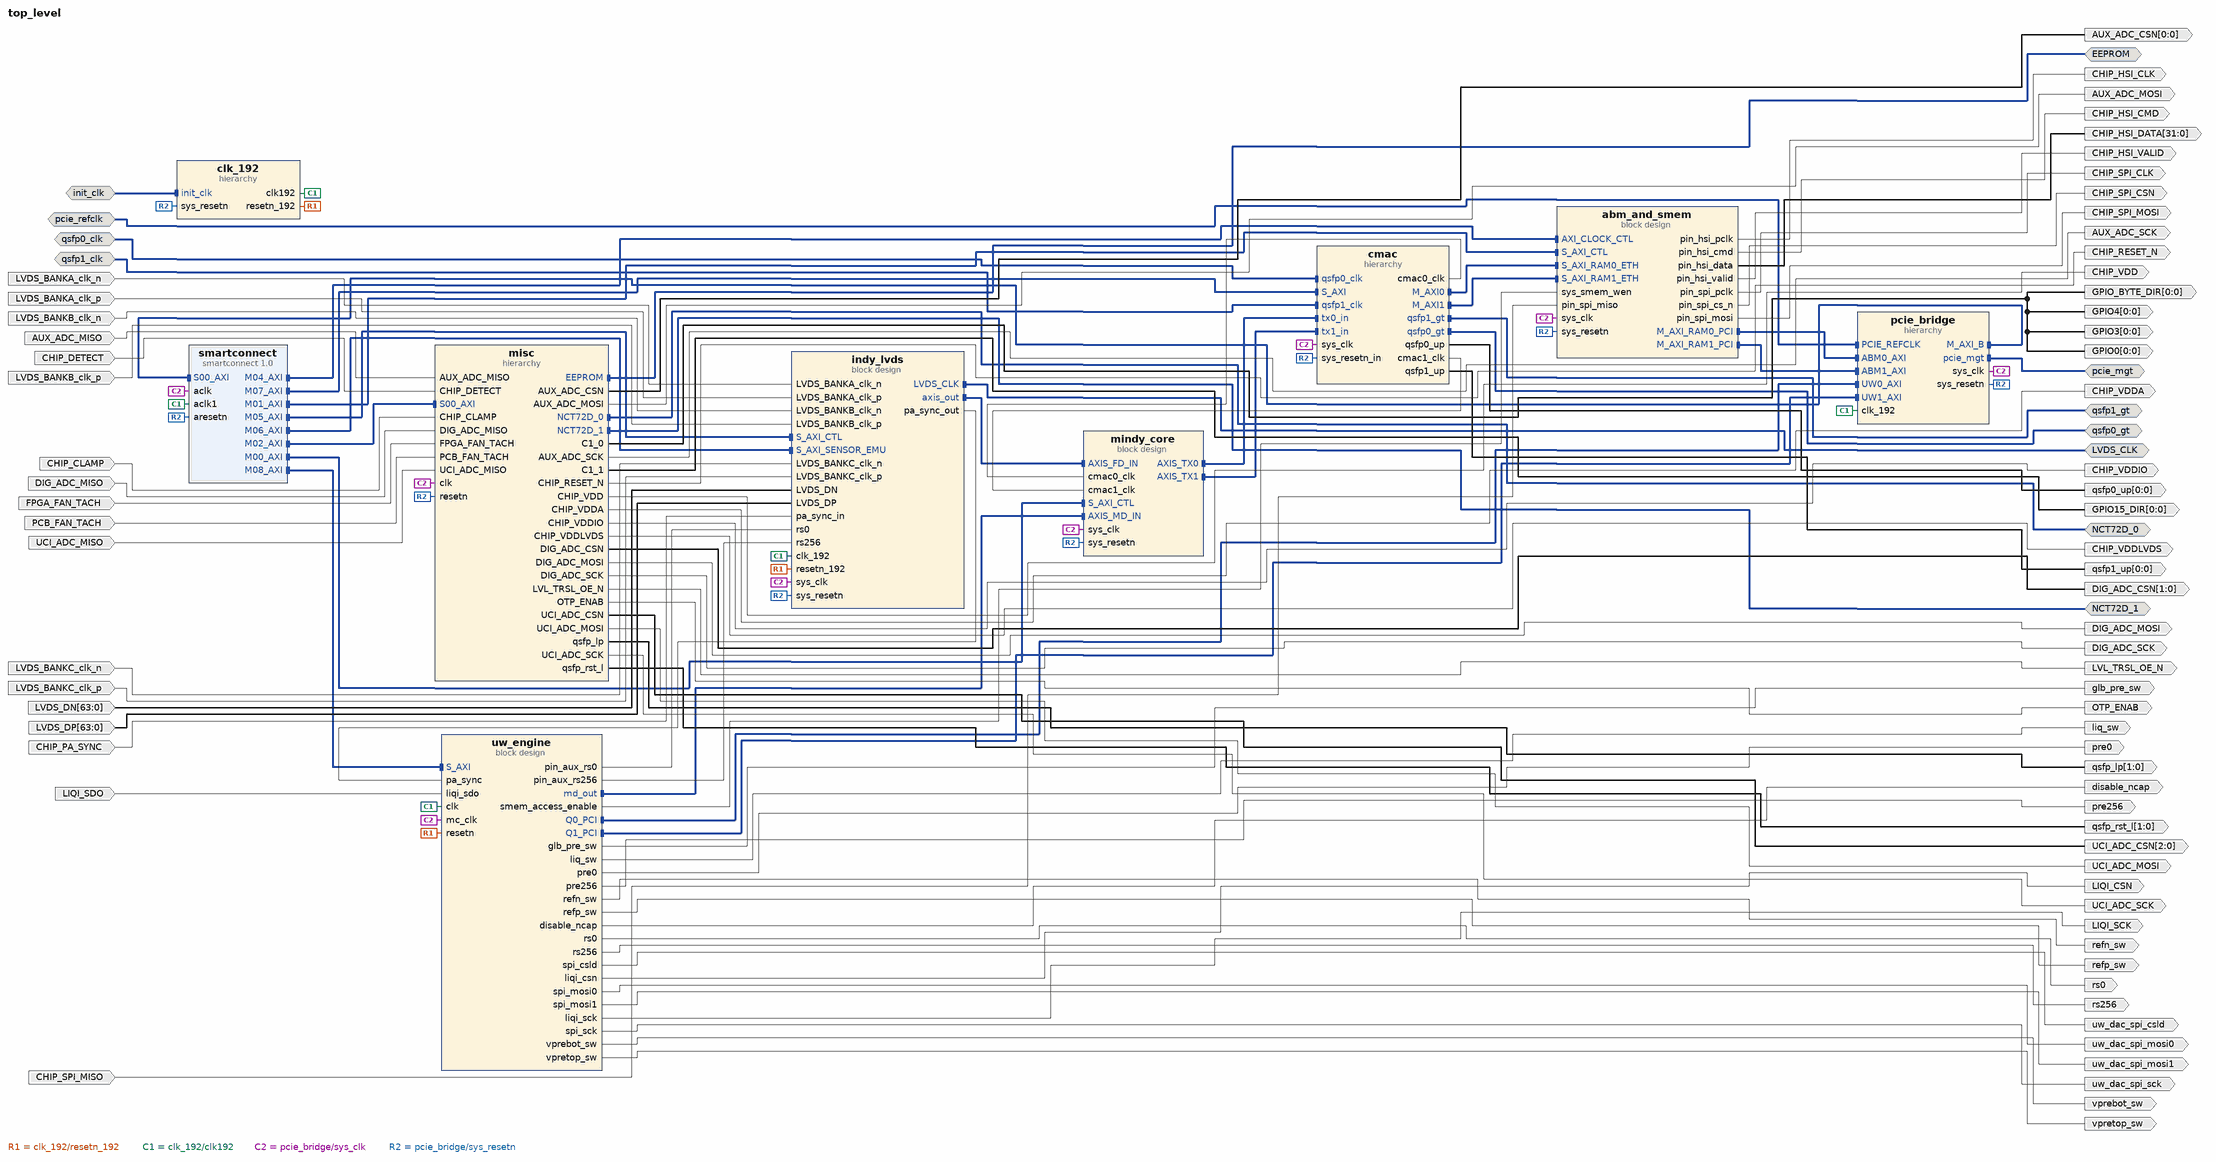
[diagram p0: block diagram of the top level]
# Vivado block design top_level, xcku15p-ffve1517-3-e, Vivado 2024.2
create_bd_design top_level

create_bd_intf_port -mode Slave -vlnv xilinx.com:interface:diff_clock_rtl:1.0 pcie_refclk
create_bd_intf_port -mode Master -vlnv xilinx.com:interface:pcie_7x_mgt_rtl:1.0 pcie_mgt
create_bd_intf_port -mode Master -vlnv xilinx.com:interface:gt_rtl:1.0 qsfp0_gt
create_bd_intf_port -mode Slave -vlnv xilinx.com:interface:diff_clock_rtl:1.0 qsfp0_clk
set_property -dict {CONFIG.FREQ_HZ 322265625} [get_bd_intf_ports qsfp0_clk]
create_bd_intf_port -mode Master -vlnv xilinx.com:interface:gt_rtl:1.0 qsfp1_gt
create_bd_intf_port -mode Slave -vlnv xilinx.com:interface:diff_clock_rtl:1.0 qsfp1_clk
set_property -dict {CONFIG.FREQ_HZ 322265625} [get_bd_intf_ports qsfp1_clk]
create_bd_intf_port -mode Slave -vlnv xilinx.com:interface:diff_clock_rtl:1.0 init_clk
set_property -dict {CONFIG.FREQ_HZ 200000000} [get_bd_intf_ports init_clk]
create_bd_intf_port -mode Master -vlnv xilinx.com:interface:diff_clock_rtl:1.0 LVDS_CLK
create_bd_intf_port -mode Master -vlnv xilinx.com:interface:iic_rtl:1.0 EEPROM
create_bd_intf_port -mode Master -vlnv xilinx.com:interface:iic_rtl:1.0 NCT72D_0
create_bd_intf_port -mode Master -vlnv xilinx.com:interface:iic_rtl:1.0 NCT72D_1
create_bd_port -dir O -from 0 -to 0 qsfp0_up
create_bd_port -dir O -from 0 -to 0 qsfp1_up
create_bd_port -dir O CHIP_HSI_CLK
create_bd_port -dir O CHIP_HSI_CMD
create_bd_port -dir O -from 31 -to 0 CHIP_HSI_DATA
create_bd_port -dir O CHIP_HSI_VALID
create_bd_port -dir O CHIP_SPI_CLK
create_bd_port -dir O CHIP_SPI_CSN
create_bd_port -dir O CHIP_SPI_MOSI
create_bd_port -dir I CHIP_SPI_MISO
create_bd_port -dir O CHIP_VDDIO
create_bd_port -dir O CHIP_VDD
create_bd_port -dir O CHIP_VDDLVDS
create_bd_port -dir O CHIP_VDDA
create_bd_port -dir O CHIP_RESET_N
create_bd_port -dir O -from 2 -to 0 UCI_ADC_CSN
create_bd_port -dir O UCI_ADC_SCK
create_bd_port -dir O UCI_ADC_MOSI
create_bd_port -dir I UCI_ADC_MISO
create_bd_port -dir O LVL_TRSL_OE_N
create_bd_port -dir O -from 1 -to 0 qsfp_rst_l
create_bd_port -dir O -from 1 -to 0 qsfp_lp
create_bd_port -dir I LVDS_BANKA_clk_n
create_bd_port -dir I LVDS_BANKA_clk_p
create_bd_port -dir I LVDS_BANKB_clk_n
create_bd_port -dir I LVDS_BANKB_clk_p
create_bd_port -dir I LVDS_BANKC_clk_n
create_bd_port -dir I LVDS_BANKC_clk_p
create_bd_port -dir I -from 63 -to 0 LVDS_DN
create_bd_port -dir I -from 63 -to 0 LVDS_DP
create_bd_port -dir I CHIP_PA_SYNC
create_bd_port -dir O rs0
create_bd_port -dir O rs256
create_bd_port -dir O -from 0 -to 0 GPIO_BYTE_DIR
create_bd_port -dir O -from 0 -to 0 GPIO15_DIR
create_bd_port -dir O glb_pre_sw
create_bd_port -dir O liq_sw
create_bd_port -dir O pre0
create_bd_port -dir O pre256
create_bd_port -dir O refn_sw
create_bd_port -dir O refp_sw
create_bd_port -dir O uw_dac_spi_csld
create_bd_port -dir O uw_dac_spi_mosi0
create_bd_port -dir O uw_dac_spi_mosi1
create_bd_port -dir O uw_dac_spi_sck
create_bd_port -dir O vprebot_sw
create_bd_port -dir O vpretop_sw
create_bd_port -dir O -from 0 -to 0 GPIO0
create_bd_port -dir O -from 0 -to 0 GPIO3
create_bd_port -dir O -from 0 -to 0 GPIO4
create_bd_port -dir O disable_ncap
create_bd_port -dir I DIG_ADC_MISO
create_bd_port -dir O DIG_ADC_SCK
create_bd_port -dir O DIG_ADC_MOSI
create_bd_port -dir O -from 1 -to 0 DIG_ADC_CSN
create_bd_port -dir I FPGA_FAN_TACH
create_bd_port -dir I PCB_FAN_TACH
create_bd_port -dir O AUX_ADC_SCK
create_bd_port -dir O AUX_ADC_MOSI
create_bd_port -dir I AUX_ADC_MISO
create_bd_port -dir O -from 0 -to 0 AUX_ADC_CSN
create_bd_port -dir O LIQI_SCK
create_bd_port -dir O LIQI_CSN
create_bd_port -dir I LIQI_SDO
create_bd_port -dir I CHIP_CLAMP
create_bd_port -dir I CHIP_DETECT
create_bd_port -dir O OTP_ENAB

create_bd_cell -type hier pcie_bridge
create_bd_cell -type ip -vlnv xilinx.com:ip:smartconnect:1.0 smartconnect
set_property -dict {CONFIG.NUM_CLKS 2 CONFIG.NUM_MI 9 CONFIG.NUM_SI 1} [get_bd_cells smartconnect]
create_bd_cell -type container -reference abm_and_smem abm_and_smem
set_property -dict [list \
  CONFIG.ACTIVE_SIM_BD abm_and_smem.bd \
  CONFIG.ACTIVE_SYNTH_BD abm_and_smem.bd \
  CONFIG.ENABLE_DFX 0 \
  CONFIG.LIST_SIM_BD abm_and_smem.bd \
  CONFIG.LIST_SYNTH_BD abm_and_smem.bd \
  CONFIG.LOCK_PROPAGATE 0 \
] [get_bd_cells abm_and_smem]
create_bd_cell -type hier cmac
create_bd_cell -type container -reference mindy_core mindy_core
set_property -dict [list \
  CONFIG.ACTIVE_SIM_BD mindy_core.bd \
  CONFIG.ACTIVE_SYNTH_BD mindy_core.bd \
  CONFIG.ENABLE_DFX 0 \
  CONFIG.LIST_SIM_BD mindy_core.bd \
  CONFIG.LIST_SYNTH_BD mindy_core.bd \
  CONFIG.LOCK_PROPAGATE 0 \
] [get_bd_cells mindy_core]
create_bd_cell -type container -reference indy_lvds indy_lvds
set_property -dict [list \
  CONFIG.ACTIVE_SIM_BD indy_lvds.bd \
  CONFIG.ACTIVE_SYNTH_BD indy_lvds.bd \
  CONFIG.ENABLE_DFX 0 \
  CONFIG.LIST_SIM_BD indy_lvds.bd \
  CONFIG.LIST_SYNTH_BD indy_lvds.bd \
  CONFIG.LOCK_PROPAGATE 0 \
] [get_bd_cells indy_lvds]
create_bd_cell -type hier clk_192
create_bd_cell -type hier misc
create_bd_cell -type container -reference userwave uw_engine
set_property -dict [list \
  CONFIG.ACTIVE_SIM_BD userwave.bd \
  CONFIG.ACTIVE_SYNTH_BD userwave.bd \
  CONFIG.ENABLE_DFX 0 \
  CONFIG.LIST_SIM_BD userwave.bd \
  CONFIG.LIST_SYNTH_BD userwave.bd \
  CONFIG.LOCK_PROPAGATE 0 \
] [get_bd_cells uw_engine]

# ---- hierarchy /pcie_bridge ----
current_bd_instance /pcie_bridge
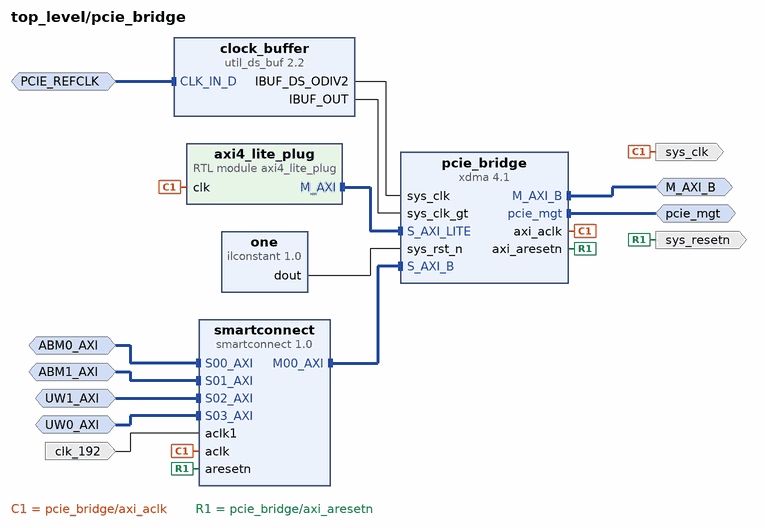
[diagram p1: block diagram inside /pcie_bridge]
create_bd_intf_pin -mode Slave -vlnv xilinx.com:interface:diff_clock_rtl:1.0 PCIE_REFCLK
create_bd_intf_pin -mode Slave -vlnv xilinx.com:interface:aximm_rtl:1.0 ABM0_AXI
create_bd_intf_pin -mode Slave -vlnv xilinx.com:interface:aximm_rtl:1.0 ABM1_AXI
create_bd_intf_pin -mode Master -vlnv xilinx.com:interface:pcie_7x_mgt_rtl:1.0 pcie_mgt
create_bd_intf_pin -mode Master -vlnv xilinx.com:interface:aximm_rtl:1.0 M_AXI_B
create_bd_intf_pin -mode Slave -vlnv xilinx.com:interface:aximm_rtl:1.0 UW1_AXI
create_bd_intf_pin -mode Slave -vlnv xilinx.com:interface:aximm_rtl:1.0 UW0_AXI
create_bd_pin -dir O -type clk sys_clk
create_bd_pin -dir O -type rst sys_resetn
create_bd_pin -dir I clk_192

create_bd_cell -type ip -vlnv xilinx.com:ip:util_ds_buf:2.2 clock_buffer
set_property -dict {CONFIG.C_BUF_TYPE IBUFDSGTE} [get_bd_cells clock_buffer]
create_bd_cell -type ip -vlnv xilinx.com:ip:smartconnect:1.0 smartconnect
set_property -dict {CONFIG.NUM_CLKS 2 CONFIG.NUM_MI 1 CONFIG.NUM_SI 4} [get_bd_cells smartconnect]
create_bd_cell -type module -reference axi4_lite_plug axi4_lite_plug
create_bd_cell -type ip -vlnv xilinx.com:ip:xdma:4.1 pcie_bridge
set_property -dict [list \
  CONFIG.PF0_DEVICE_ID_mqdma 903F \
  CONFIG.PF0_SRIOV_VF_DEVICE_ID A03F \
  CONFIG.PF2_DEVICE_ID_mqdma 923F \
  CONFIG.PF3_DEVICE_ID_mqdma 933F \
  CONFIG.axi_addr_width 64 \
  CONFIG.axi_data_width 512_bit \
  CONFIG.axisten_freq 250 \
  CONFIG.bridge_burst true \
  CONFIG.en_axi_slave_if true \
  CONFIG.en_gt_selection false \
  CONFIG.functional_mode AXI_Bridge \
  CONFIG.mode_selection Advanced \
  CONFIG.pcie_blk_locn X0Y3 \
  CONFIG.pf0_bar0_scale Megabytes \
  CONFIG.pf0_bar0_size 1 \
  CONFIG.pf0_device_id 903F \
  CONFIG.pf0_msi_enabled false \
  CONFIG.pl_link_cap_max_link_speed 8.0_GT/s \
  CONFIG.pl_link_cap_max_link_width X16 \
  CONFIG.runbit_fix false \
  CONFIG.xlnx_ref_board None \
] [get_bd_cells pcie_bridge]
create_bd_cell -type inline_hdl -vlnv xilinx.com:inline_hdl:ilconstant:1.0 one

# ---- hierarchy /cmac ----
current_bd_instance /cmac
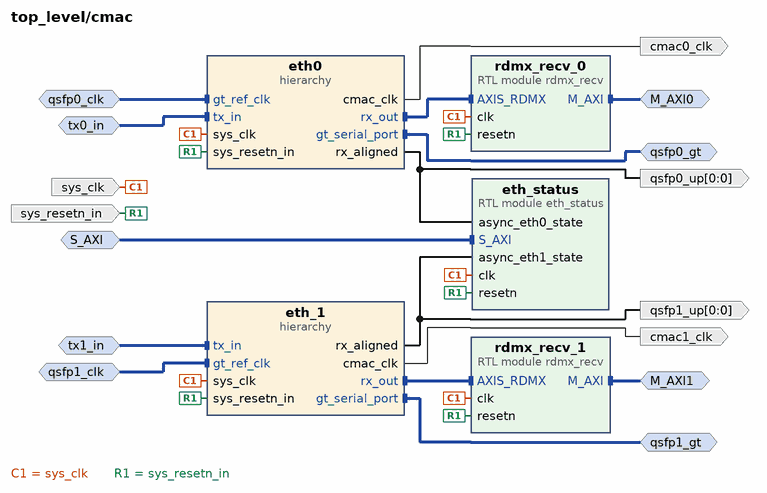
[diagram p2: block diagram inside /cmac]
create_bd_intf_pin -mode Master -vlnv xilinx.com:interface:gt_rtl:1.0 qsfp0_gt
create_bd_intf_pin -mode Slave -vlnv xilinx.com:interface:diff_clock_rtl:1.0 qsfp0_clk
create_bd_intf_pin -mode Slave -vlnv xilinx.com:interface:axis_rtl:1.0 tx0_in
create_bd_intf_pin -mode Master -vlnv xilinx.com:interface:aximm_rtl:1.0 M_AXI0
create_bd_intf_pin -mode Master -vlnv xilinx.com:interface:gt_rtl:1.0 qsfp1_gt
create_bd_intf_pin -mode Slave -vlnv xilinx.com:interface:diff_clock_rtl:1.0 qsfp1_clk
create_bd_intf_pin -mode Slave -vlnv xilinx.com:interface:axis_rtl:1.0 tx1_in
create_bd_intf_pin -mode Master -vlnv xilinx.com:interface:aximm_rtl:1.0 M_AXI1
create_bd_intf_pin -mode Slave -vlnv xilinx.com:interface:aximm_rtl:1.0 S_AXI
create_bd_pin -dir I sys_clk
create_bd_pin -dir I sys_resetn_in
create_bd_pin -dir O -from 0 -to 0 qsfp0_up
create_bd_pin -dir O cmac0_clk
create_bd_pin -dir O -from 0 -to 0 qsfp1_up
create_bd_pin -dir O cmac1_clk

create_bd_cell -type hier eth0
create_bd_cell -type module -reference rdmx_recv rdmx_recv_0
create_bd_cell -type hier eth_1
create_bd_cell -type module -reference rdmx_recv rdmx_recv_1
create_bd_cell -type module -reference eth_status eth_status

# ---- hierarchy /cmac/eth0 ----
current_bd_instance /cmac/eth0
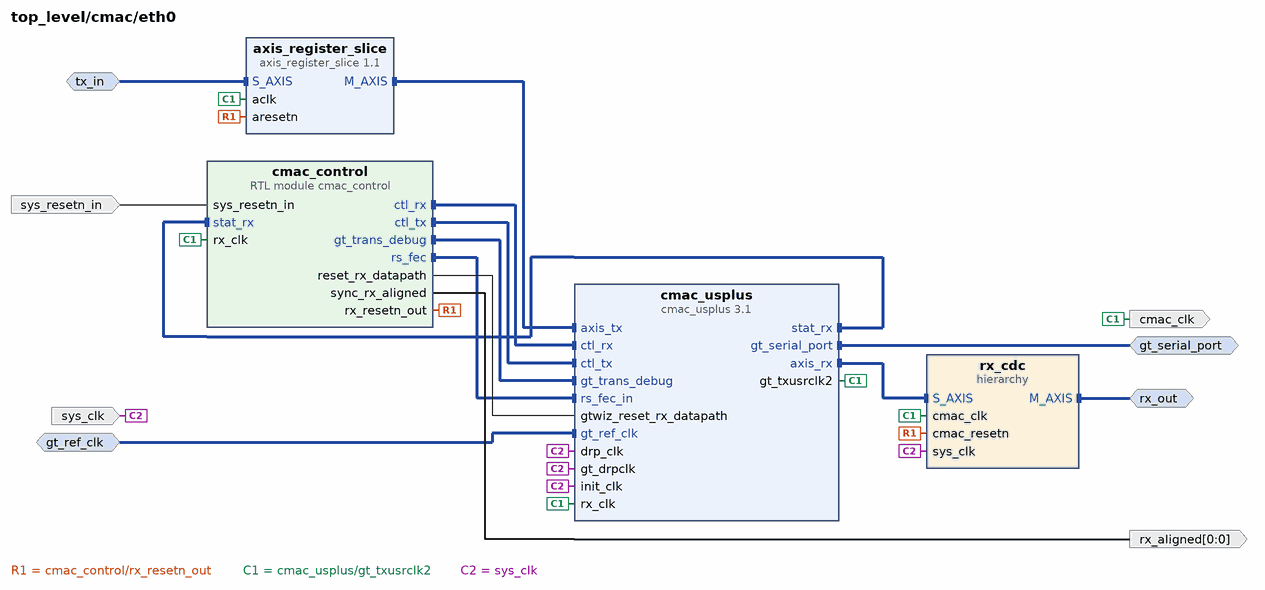
[diagram p3: block diagram inside /cmac/eth0]
create_bd_intf_pin -mode Master -vlnv xilinx.com:interface:gt_rtl:1.0 gt_serial_port
create_bd_intf_pin -mode Slave -vlnv xilinx.com:interface:diff_clock_rtl:1.0 gt_ref_clk
create_bd_intf_pin -mode Master -vlnv xilinx.com:interface:axis_rtl:1.0 rx_out
create_bd_intf_pin -mode Slave -vlnv xilinx.com:interface:axis_rtl:1.0 tx_in
create_bd_pin -dir I sys_resetn_in
create_bd_pin -dir I sys_clk
create_bd_pin -dir O -from 0 -to 0 rx_aligned
create_bd_pin -dir O cmac_clk

create_bd_cell -type ip -vlnv xilinx.com:ip:cmac_usplus:3.1 cmac_usplus
set_property -dict [list \
  CONFIG.ADD_GT_CNRL_STS_PORTS 1 \
  CONFIG.CMAC_CAUI4_MODE 1 \
  CONFIG.CMAC_CORE_SELECT CMACE4_X0Y0 \
  CONFIG.DIFFCLK_BOARD_INTERFACE Custom \
  CONFIG.ETHERNET_BOARD_INTERFACE Custom \
  CONFIG.GT_DRP_CLK 250 \
  CONFIG.GT_GROUP_SELECT {X0Y0~X0Y3} \
  CONFIG.GT_REF_CLK_FREQ 322.265625 \
  CONFIG.INCLUDE_RS_FEC 1 \
  CONFIG.NUM_LANES 4x25 \
  CONFIG.RX_FLOW_CONTROL 0 \
  CONFIG.RX_GT_BUFFER 1 \
  CONFIG.TX_FLOW_CONTROL 0 \
  CONFIG.USER_INTERFACE AXIS \
] [get_bd_cells cmac_usplus]
create_bd_cell -type module -reference cmac_control cmac_control
set_property -dict {CONFIG.TX_PRECURSOR {"10100"}} [get_bd_cells cmac_control]
create_bd_cell -type hier rx_cdc
create_bd_cell -type ip -vlnv xilinx.com:ip:axis_register_slice:1.1 axis_register_slice

# ---- hierarchy /cmac/eth0/rx_cdc ----
current_bd_instance /cmac/eth0/rx_cdc
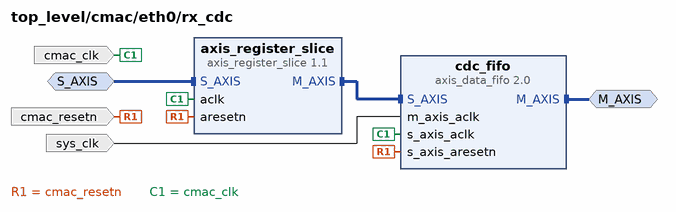
[diagram p4: block diagram inside /cmac/eth0/rx_cdc]
create_bd_intf_pin -mode Slave -vlnv xilinx.com:interface:axis_rtl:1.0 S_AXIS
create_bd_intf_pin -mode Master -vlnv xilinx.com:interface:axis_rtl:1.0 M_AXIS
create_bd_pin -dir I -type rst cmac_resetn
create_bd_pin -dir I -type clk cmac_clk
create_bd_pin -dir I sys_clk

create_bd_cell -type ip -vlnv xilinx.com:ip:axis_data_fifo:2.0 cdc_fifo
set_property -dict {CONFIG.FIFO_DEPTH 16 CONFIG.IS_ACLK_ASYNC 1} [get_bd_cells cdc_fifo]
create_bd_cell -type ip -vlnv xilinx.com:ip:axis_register_slice:1.1 axis_register_slice

# ---- hierarchy /cmac/eth_1 ----
current_bd_instance /cmac/eth_1
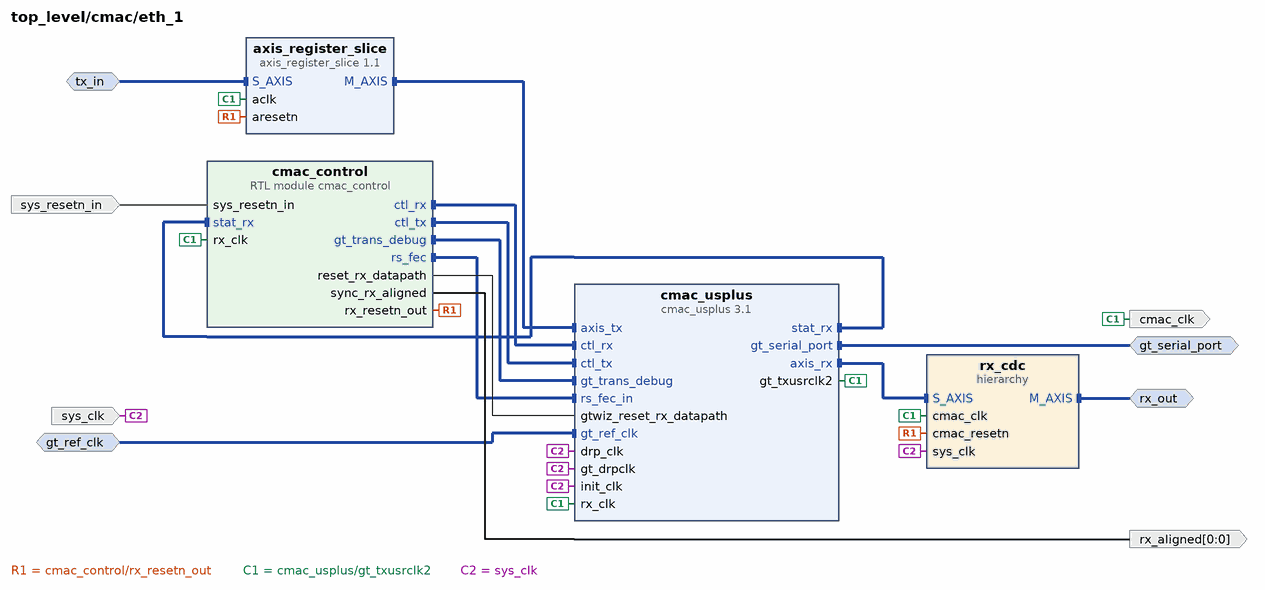
[diagram p5: block diagram inside /cmac/eth_1]
create_bd_intf_pin -mode Master -vlnv xilinx.com:interface:gt_rtl:1.0 gt_serial_port
create_bd_intf_pin -mode Slave -vlnv xilinx.com:interface:diff_clock_rtl:1.0 gt_ref_clk
create_bd_intf_pin -mode Master -vlnv xilinx.com:interface:axis_rtl:1.0 rx_out
create_bd_intf_pin -mode Slave -vlnv xilinx.com:interface:axis_rtl:1.0 tx_in
create_bd_pin -dir I sys_resetn_in
create_bd_pin -dir I sys_clk
create_bd_pin -dir O -from 0 -to 0 rx_aligned
create_bd_pin -dir O cmac_clk

create_bd_cell -type ip -vlnv xilinx.com:ip:cmac_usplus:3.1 cmac_usplus
set_property -dict [list \
  CONFIG.ADD_GT_CNRL_STS_PORTS 1 \
  CONFIG.CMAC_CAUI4_MODE 1 \
  CONFIG.CMAC_CORE_SELECT CMACE4_X0Y1 \
  CONFIG.DIFFCLK_BOARD_INTERFACE Custom \
  CONFIG.ETHERNET_BOARD_INTERFACE Custom \
  CONFIG.GT_DRP_CLK 250 \
  CONFIG.GT_GROUP_SELECT {X0Y4~X0Y7} \
  CONFIG.GT_REF_CLK_FREQ 322.265625 \
  CONFIG.INCLUDE_RS_FEC 1 \
  CONFIG.NUM_LANES 4x25 \
  CONFIG.RX_FLOW_CONTROL 0 \
  CONFIG.RX_GT_BUFFER 1 \
  CONFIG.TX_FLOW_CONTROL 0 \
  CONFIG.USER_INTERFACE AXIS \
] [get_bd_cells cmac_usplus]
create_bd_cell -type module -reference cmac_control cmac_control
set_property -dict {CONFIG.TX_PRECURSOR {"10100"}} [get_bd_cells cmac_control]
create_bd_cell -type hier rx_cdc
create_bd_cell -type ip -vlnv xilinx.com:ip:axis_register_slice:1.1 axis_register_slice

# ---- hierarchy /cmac/eth_1/rx_cdc ----
current_bd_instance /cmac/eth_1/rx_cdc
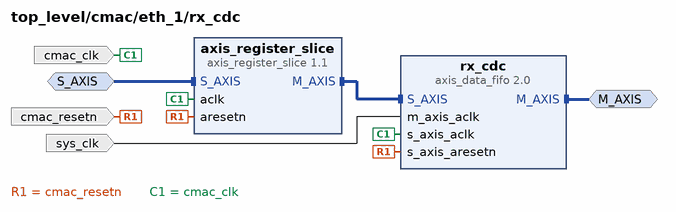
[diagram p6: block diagram inside /cmac/eth_1/rx_cdc]
create_bd_intf_pin -mode Slave -vlnv xilinx.com:interface:axis_rtl:1.0 S_AXIS
create_bd_intf_pin -mode Master -vlnv xilinx.com:interface:axis_rtl:1.0 M_AXIS
create_bd_pin -dir I -type rst cmac_resetn
create_bd_pin -dir I -type clk cmac_clk
create_bd_pin -dir I sys_clk

create_bd_cell -type ip -vlnv xilinx.com:ip:axis_data_fifo:2.0 rx_cdc
set_property -dict {CONFIG.FIFO_DEPTH 16 CONFIG.IS_ACLK_ASYNC 1} [get_bd_cells rx_cdc]
create_bd_cell -type ip -vlnv xilinx.com:ip:axis_register_slice:1.1 axis_register_slice

# ---- hierarchy /clk_192 ----
current_bd_instance /clk_192
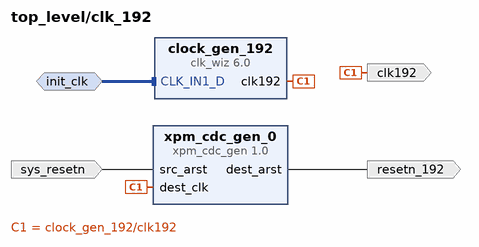
[diagram p7: block diagram inside /clk_192]
create_bd_intf_pin -mode Slave -vlnv xilinx.com:interface:diff_clock_rtl:1.0 init_clk
create_bd_pin -dir O -type clk clk192
create_bd_pin -dir I sys_resetn
create_bd_pin -dir O resetn_192

create_bd_cell -type ip -vlnv xilinx.com:ip:clk_wiz:6.0 clock_gen_192
set_property -dict [list \
  CONFIG.CLKOUT1_JITTER 93.529 \
  CONFIG.CLKOUT1_REQUESTED_OUT_FREQ 192 \
  CONFIG.CLK_OUT1_PORT clk192 \
  CONFIG.MMCM_CLKOUT0_DIVIDE_F 6.250 \
  CONFIG.PRIM_SOURCE Differential_clock_capable_pin \
  CONFIG.USE_LOCKED false \
  CONFIG.USE_RESET false \
] [get_bd_cells clock_gen_192]
create_bd_cell -type ip -vlnv xilinx.com:ip:xpm_cdc_gen:1.0 xpm_cdc_gen_0
set_property -dict {CONFIG.CDC_TYPE xpm_cdc_async_rst} [get_bd_cells xpm_cdc_gen_0]

# ---- hierarchy /misc ----
current_bd_instance /misc
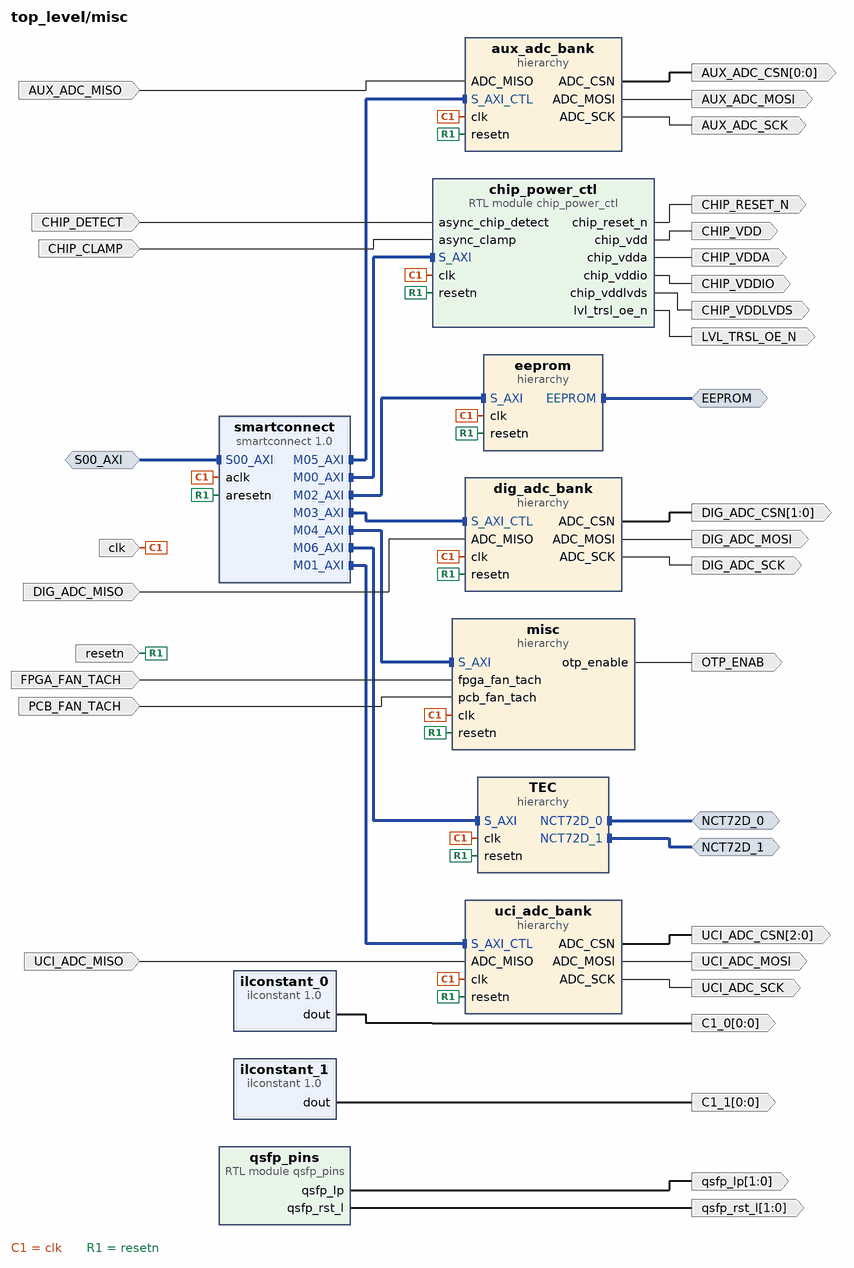
[diagram p8: block diagram inside /misc]
create_bd_intf_pin -mode Slave -vlnv xilinx.com:interface:aximm_rtl:1.0 S00_AXI
create_bd_intf_pin -mode Master -vlnv xilinx.com:interface:iic_rtl:1.0 EEPROM
create_bd_intf_pin -mode Master -vlnv xilinx.com:interface:iic_rtl:1.0 NCT72D_0
create_bd_intf_pin -mode Master -vlnv xilinx.com:interface:iic_rtl:1.0 NCT72D_1
create_bd_pin -dir O -from 0 -to 0 C1_0
create_bd_pin -dir O -from 0 -to 0 C1_1
create_bd_pin -dir O CHIP_VDDIO
create_bd_pin -dir O CHIP_VDD
create_bd_pin -dir O CHIP_VDDLVDS
create_bd_pin -dir O CHIP_VDDA
create_bd_pin -dir O CHIP_RESET_N
create_bd_pin -dir O LVL_TRSL_OE_N
create_bd_pin -dir I -type clk clk
create_bd_pin -dir I -type rst resetn
create_bd_pin -dir O -from 1 -to 0 qsfp_rst_l
create_bd_pin -dir O -from 1 -to 0 qsfp_lp
create_bd_pin -dir O -from 2 -to 0 UCI_ADC_CSN
create_bd_pin -dir O UCI_ADC_SCK
create_bd_pin -dir O UCI_ADC_MOSI
create_bd_pin -dir I UCI_ADC_MISO
create_bd_pin -dir I DIG_ADC_MISO
create_bd_pin -dir O DIG_ADC_SCK
create_bd_pin -dir O DIG_ADC_MOSI
create_bd_pin -dir O -from 1 -to 0 DIG_ADC_CSN
create_bd_pin -dir I FPGA_FAN_TACH
create_bd_pin -dir I PCB_FAN_TACH
create_bd_pin -dir O AUX_ADC_SCK
create_bd_pin -dir O AUX_ADC_MOSI
create_bd_pin -dir O -from 0 -to 0 AUX_ADC_CSN
create_bd_pin -dir I AUX_ADC_MISO
create_bd_pin -dir I CHIP_CLAMP
create_bd_pin -dir I CHIP_DETECT
create_bd_pin -dir O OTP_ENAB

create_bd_cell -type inline_hdl -vlnv xilinx.com:inline_hdl:ilconstant:1.0 ilconstant_0
set_property -dict {CONFIG.CONST_VAL 0} [get_bd_cells ilconstant_0]
create_bd_cell -type inline_hdl -vlnv xilinx.com:inline_hdl:ilconstant:1.0 ilconstant_1
set_property -dict {CONFIG.CONST_VAL 1} [get_bd_cells ilconstant_1]
create_bd_cell -type module -reference qsfp_pins qsfp_pins
create_bd_cell -type hier uci_adc_bank
create_bd_cell -type module -reference chip_power_ctl chip_power_ctl
create_bd_cell -type ip -vlnv xilinx.com:ip:smartconnect:1.0 smartconnect
set_property -dict {CONFIG.NUM_MI 7 CONFIG.NUM_SI 1} [get_bd_cells smartconnect]
create_bd_cell -type hier dig_adc_bank
create_bd_cell -type hier misc
create_bd_cell -type hier aux_adc_bank
create_bd_cell -type hier eeprom
create_bd_cell -type hier TEC

# ---- hierarchy /misc/uci_adc_bank ----
current_bd_instance /misc/uci_adc_bank
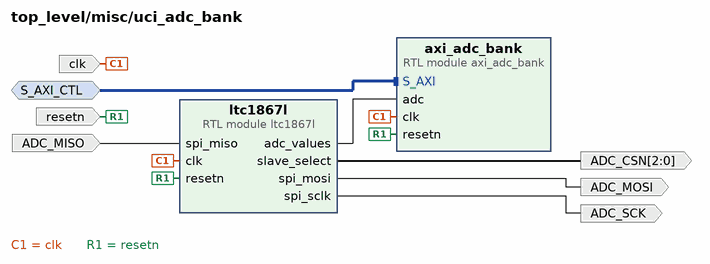
[diagram p9: block diagram inside /misc/uci_adc_bank]
create_bd_intf_pin -mode Slave -vlnv xilinx.com:interface:aximm_rtl:1.0 S_AXI_CTL
create_bd_pin -dir I -type clk clk
create_bd_pin -dir I -type rst resetn
create_bd_pin -dir O -from 2 -to 0 ADC_CSN
create_bd_pin -dir O ADC_SCK
create_bd_pin -dir O ADC_MOSI
create_bd_pin -dir I ADC_MISO

create_bd_cell -type module -reference axi_adc_bank axi_adc_bank
set_property -dict {CONFIG.ADC_COUNT 3} [get_bd_cells axi_adc_bank]
create_bd_cell -type module -reference ltc1867l ltc1867l
set_property -dict {CONFIG.ADC_COUNT 3} [get_bd_cells ltc1867l]

# ---- hierarchy /misc/dig_adc_bank ----
current_bd_instance /misc/dig_adc_bank
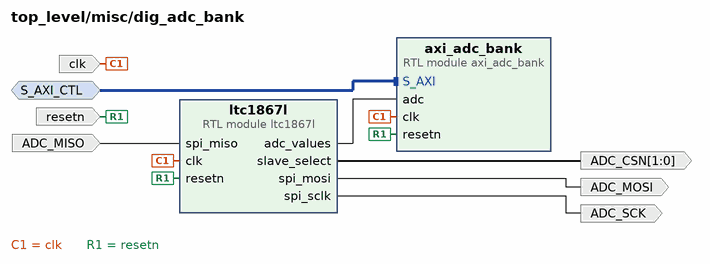
[diagram p10: block diagram inside /misc/dig_adc_bank]
create_bd_intf_pin -mode Slave -vlnv xilinx.com:interface:aximm_rtl:1.0 S_AXI_CTL
create_bd_pin -dir I -type clk clk
create_bd_pin -dir I -type rst resetn
create_bd_pin -dir O ADC_SCK
create_bd_pin -dir O ADC_MOSI
create_bd_pin -dir I ADC_MISO
create_bd_pin -dir O -from 1 -to 0 ADC_CSN

create_bd_cell -type module -reference axi_adc_bank axi_adc_bank
set_property -dict {CONFIG.ADC_COUNT 2} [get_bd_cells axi_adc_bank]
create_bd_cell -type module -reference ltc1867l ltc1867l
set_property -dict {CONFIG.ADC_COUNT 2} [get_bd_cells ltc1867l]

# ---- hierarchy /misc/misc ----
current_bd_instance /misc/misc
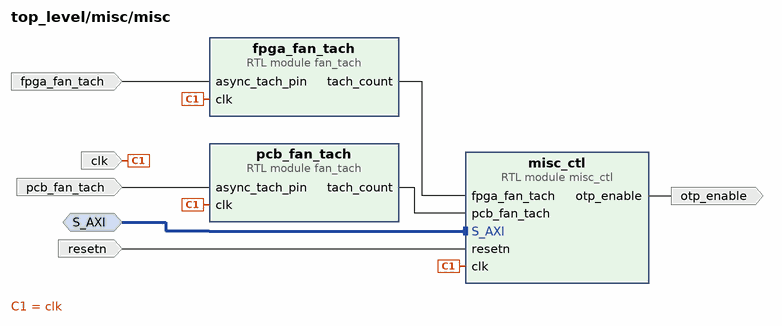
[diagram p11: block diagram inside /misc/misc]
create_bd_intf_pin -mode Slave -vlnv xilinx.com:interface:aximm_rtl:1.0 S_AXI
create_bd_pin -dir I clk
create_bd_pin -dir I resetn
create_bd_pin -dir I fpga_fan_tach
create_bd_pin -dir I pcb_fan_tach
create_bd_pin -dir O otp_enable

create_bd_cell -type module -reference misc_ctl misc_ctl
create_bd_cell -type module -reference fan_tach fpga_fan_tach
create_bd_cell -type module -reference fan_tach pcb_fan_tach

# ---- hierarchy /misc/aux_adc_bank ----
current_bd_instance /misc/aux_adc_bank
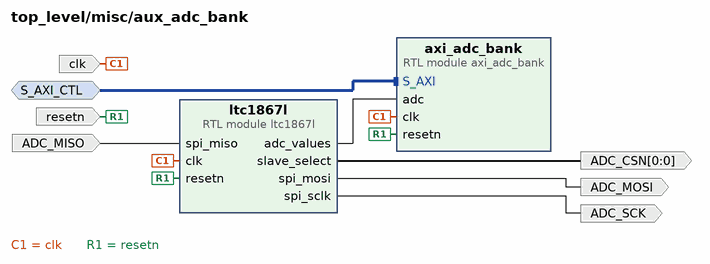
[diagram p12: block diagram inside /misc/aux_adc_bank]
create_bd_intf_pin -mode Slave -vlnv xilinx.com:interface:aximm_rtl:1.0 S_AXI_CTL
create_bd_pin -dir I -type clk clk
create_bd_pin -dir I -type rst resetn
create_bd_pin -dir O ADC_SCK
create_bd_pin -dir O ADC_MOSI
create_bd_pin -dir I ADC_MISO
create_bd_pin -dir O -from 0 -to 0 ADC_CSN

create_bd_cell -type module -reference axi_adc_bank axi_adc_bank
set_property -dict {CONFIG.ADC_COUNT 1} [get_bd_cells axi_adc_bank]
create_bd_cell -type module -reference ltc1867l ltc1867l
set_property -dict {CONFIG.ADC_COUNT 1} [get_bd_cells ltc1867l]

# ---- hierarchy /misc/eeprom ----
current_bd_instance /misc/eeprom
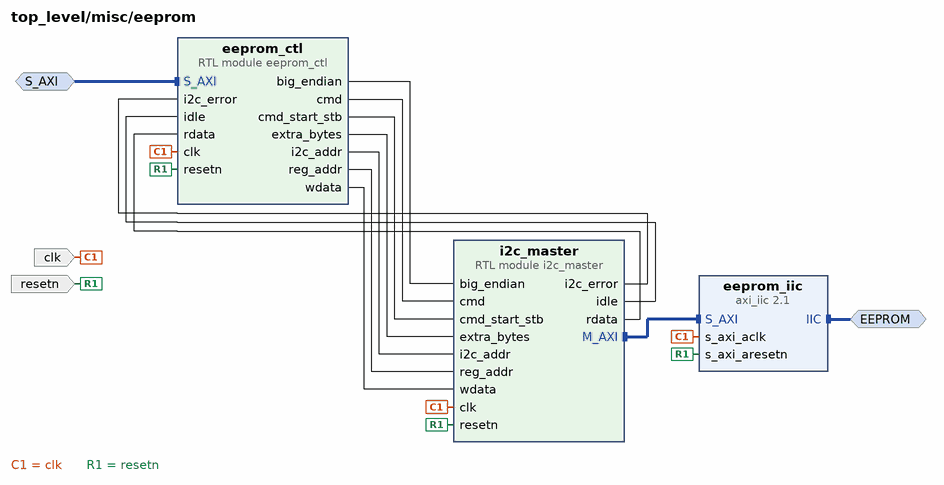
[diagram p13: block diagram inside /misc/eeprom]
create_bd_intf_pin -mode Slave -vlnv xilinx.com:interface:aximm_rtl:1.0 S_AXI
create_bd_intf_pin -mode Master -vlnv xilinx.com:interface:iic_rtl:1.0 EEPROM
create_bd_pin -dir I -type clk clk
create_bd_pin -dir I -type rst resetn

create_bd_cell -type ip -vlnv xilinx.com:ip:axi_iic:2.1 eeprom_iic
create_bd_cell -type module -reference i2c_master i2c_master
create_bd_cell -type module -reference eeprom_ctl eeprom_ctl

# ---- hierarchy /misc/TEC ----
current_bd_instance /misc/TEC
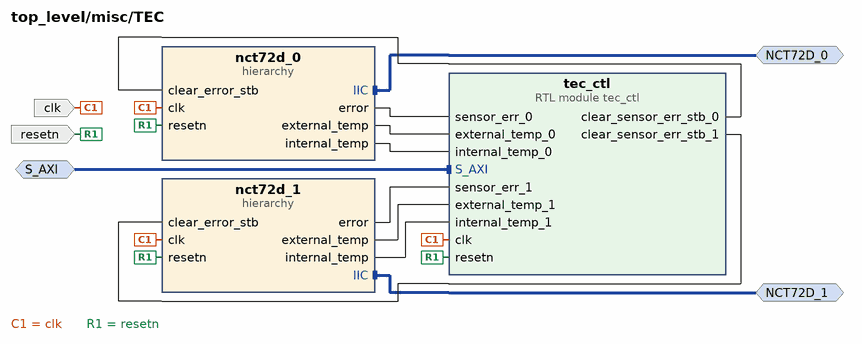
[diagram p14: block diagram inside /misc/TEC]
create_bd_intf_pin -mode Master -vlnv xilinx.com:interface:iic_rtl:1.0 NCT72D_0
create_bd_intf_pin -mode Master -vlnv xilinx.com:interface:iic_rtl:1.0 NCT72D_1
create_bd_intf_pin -mode Slave -vlnv xilinx.com:interface:aximm_rtl:1.0 S_AXI
create_bd_pin -dir I clk
create_bd_pin -dir I resetn

create_bd_cell -type hier nct72d_0
create_bd_cell -type hier nct72d_1
create_bd_cell -type module -reference tec_ctl tec_ctl

# ---- hierarchy /misc/TEC/nct72d_0 ----
current_bd_instance /misc/TEC/nct72d_0
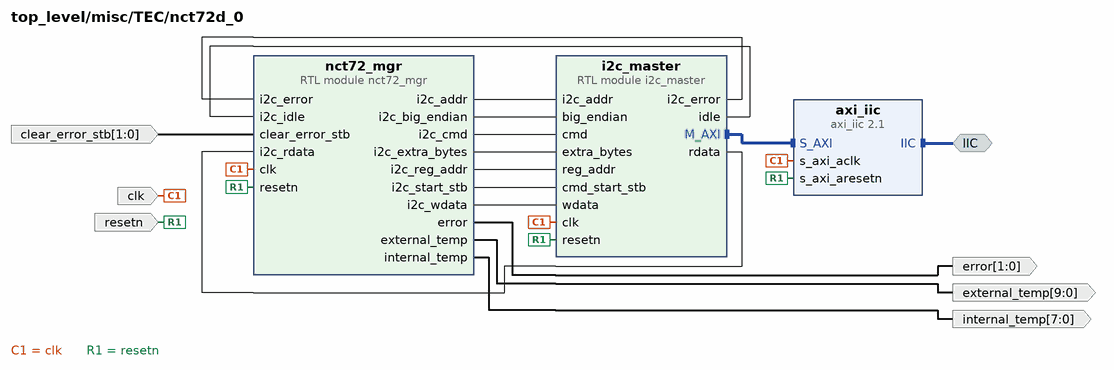
[diagram p15: block diagram inside /misc/TEC/nct72d_0]
create_bd_intf_pin -mode Master -vlnv xilinx.com:interface:iic_rtl:1.0 IIC
create_bd_pin -dir I clk
create_bd_pin -dir I resetn
create_bd_pin -dir O -from 1 -to 0 error
create_bd_pin -dir O -from 7 -to 0 internal_temp
create_bd_pin -dir O -from 9 -to 0 external_temp
create_bd_pin -dir I -from 1 -to 0 clear_error_stb

create_bd_cell -type module -reference nct72_mgr nct72_mgr
create_bd_cell -type module -reference i2c_master i2c_master
create_bd_cell -type ip -vlnv xilinx.com:ip:axi_iic:2.1 axi_iic

# ---- hierarchy /misc/TEC/nct72d_1 ----
current_bd_instance /misc/TEC/nct72d_1
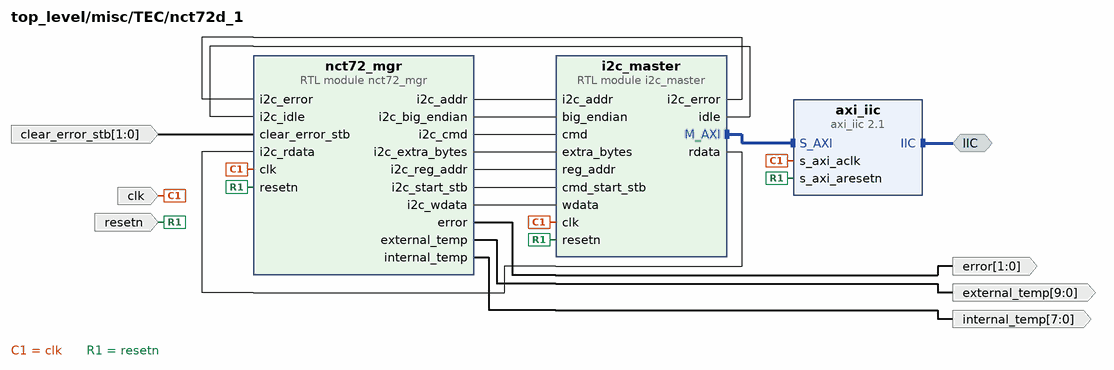
[diagram p16: block diagram inside /misc/TEC/nct72d_1]
create_bd_intf_pin -mode Master -vlnv xilinx.com:interface:iic_rtl:1.0 IIC
create_bd_pin -dir I clk
create_bd_pin -dir I resetn
create_bd_pin -dir O -from 1 -to 0 error
create_bd_pin -dir O -from 7 -to 0 internal_temp
create_bd_pin -dir O -from 9 -to 0 external_temp
create_bd_pin -dir I -from 1 -to 0 clear_error_stb

create_bd_cell -type module -reference nct72_mgr nct72_mgr
create_bd_cell -type module -reference i2c_master i2c_master
create_bd_cell -type ip -vlnv xilinx.com:ip:axi_iic:2.1 axi_iic

# ---- connections ----

current_bd_instance /pcie_bridge
connect_bd_intf_net [get_bd_intf_pins PCIE_REFCLK] [get_bd_intf_pins clock_buffer/CLK_IN_D]
connect_bd_intf_net [get_bd_intf_pins pcie_bridge/pcie_mgt] [get_bd_intf_pins pcie_mgt]
connect_bd_intf_net [get_bd_intf_pins pcie_bridge/M_AXI_B] [get_bd_intf_pins M_AXI_B]
connect_bd_intf_net [get_bd_intf_pins ABM0_AXI] [get_bd_intf_pins smartconnect/S00_AXI]
connect_bd_intf_net [get_bd_intf_pins ABM1_AXI] [get_bd_intf_pins smartconnect/S01_AXI]
connect_bd_intf_net [get_bd_intf_pins UW1_AXI] [get_bd_intf_pins smartconnect/S02_AXI]
connect_bd_intf_net [get_bd_intf_pins UW0_AXI] [get_bd_intf_pins smartconnect/S03_AXI]
connect_bd_intf_net [get_bd_intf_pins axi4_lite_plug/M_AXI] [get_bd_intf_pins pcie_bridge/S_AXI_LITE]
connect_bd_intf_net [get_bd_intf_pins smartconnect/M00_AXI] [get_bd_intf_pins pcie_bridge/S_AXI_B]
connect_bd_net -net clk_192_1 [get_bd_pins clk_192] [get_bd_pins smartconnect/aclk1]
connect_bd_net [get_bd_pins clock_buffer/IBUF_DS_ODIV2] [get_bd_pins pcie_bridge/sys_clk]
connect_bd_net [get_bd_pins clock_buffer/IBUF_OUT] [get_bd_pins pcie_bridge/sys_clk_gt]
connect_bd_net [get_bd_pins one/dout] [get_bd_pins pcie_bridge/sys_rst_n]
connect_bd_net -net pcie_bridge_0_axi_aclk [get_bd_pins pcie_bridge/axi_aclk] \
  [get_bd_pins sys_clk] [get_bd_pins smartconnect/aclk] [get_bd_pins axi4_lite_plug/clk]
connect_bd_net -net pcie_bridge_0_axi_aresetn [get_bd_pins pcie_bridge/axi_aresetn] [get_bd_pins sys_resetn] [get_bd_pins smartconnect/aresetn]

current_bd_instance /cmac
connect_bd_intf_net [get_bd_intf_pins S_AXI] [get_bd_intf_pins eth_status/S_AXI]
connect_bd_intf_net [get_bd_intf_pins M_AXI0] [get_bd_intf_pins rdmx_recv_0/M_AXI]
connect_bd_intf_net [get_bd_intf_pins M_AXI1] [get_bd_intf_pins rdmx_recv_1/M_AXI]
connect_bd_intf_net [get_bd_intf_pins qsfp1_gt] [get_bd_intf_pins eth_1/gt_serial_port]
connect_bd_intf_net [get_bd_intf_pins qsfp0_gt] [get_bd_intf_pins eth0/gt_serial_port]
connect_bd_intf_net [get_bd_intf_pins eth0/rx_out] [get_bd_intf_pins rdmx_recv_0/AXIS_RDMX]
connect_bd_intf_net [get_bd_intf_pins rdmx_recv_1/AXIS_RDMX] [get_bd_intf_pins eth_1/rx_out]
connect_bd_intf_net [get_bd_intf_pins qsfp0_clk] [get_bd_intf_pins eth0/gt_ref_clk]
connect_bd_intf_net [get_bd_intf_pins tx0_in] [get_bd_intf_pins eth0/tx_in]
connect_bd_intf_net [get_bd_intf_pins tx1_in] [get_bd_intf_pins eth_1/tx_in]
connect_bd_intf_net [get_bd_intf_pins qsfp1_clk] [get_bd_intf_pins eth_1/gt_ref_clk]
connect_bd_net -net channel_0_cmac_clk [get_bd_pins eth0/cmac_clk] [get_bd_pins cmac0_clk]
connect_bd_net -net channel_0_rx_aligned [get_bd_pins eth0/rx_aligned] [get_bd_pins qsfp0_up] [get_bd_pins eth_status/async_eth0_state]
connect_bd_net -net channel_1_cmac_clk [get_bd_pins eth_1/cmac_clk] [get_bd_pins cmac1_clk]
connect_bd_net -net channel_1_rx_aligned [get_bd_pins eth_1/rx_aligned] [get_bd_pins qsfp1_up] [get_bd_pins eth_status/async_eth1_state]
connect_bd_net -net pcie_bridge_0_axi_aclk [get_bd_pins sys_clk] \
  [get_bd_pins eth0/sys_clk] [get_bd_pins eth_1/sys_clk] [get_bd_pins eth_status/clk] [get_bd_pins rdmx_recv_0/clk] \
  [get_bd_pins rdmx_recv_1/clk]
connect_bd_net -net pcie_bridge_0_axi_aresetn [get_bd_pins sys_resetn_in] \
  [get_bd_pins eth0/sys_resetn_in] [get_bd_pins eth_1/sys_resetn_in] [get_bd_pins eth_status/resetn] \
  [get_bd_pins rdmx_recv_0/resetn] [get_bd_pins rdmx_recv_1/resetn]

current_bd_instance /cmac/eth0
connect_bd_intf_net [get_bd_intf_pins rx_out] [get_bd_intf_pins rx_cdc/M_AXIS]
connect_bd_intf_net [get_bd_intf_pins axis_register_slice/M_AXIS] [get_bd_intf_pins cmac_usplus/axis_tx]
connect_bd_intf_net [get_bd_intf_pins cmac_control/ctl_rx] [get_bd_intf_pins cmac_usplus/ctl_rx]
connect_bd_intf_net [get_bd_intf_pins cmac_control/ctl_tx] [get_bd_intf_pins cmac_usplus/ctl_tx]
connect_bd_intf_net [get_bd_intf_pins cmac_control/gt_trans_debug] [get_bd_intf_pins cmac_usplus/gt_trans_debug]
connect_bd_intf_net [get_bd_intf_pins cmac_control/rs_fec] [get_bd_intf_pins cmac_usplus/rs_fec_in]
connect_bd_intf_net [get_bd_intf_pins cmac_usplus/axis_rx] [get_bd_intf_pins rx_cdc/S_AXIS]
connect_bd_intf_net [get_bd_intf_pins gt_serial_port] [get_bd_intf_pins cmac_usplus/gt_serial_port]
connect_bd_intf_net [get_bd_intf_pins cmac_control/stat_rx] [get_bd_intf_pins cmac_usplus/stat_rx]
connect_bd_intf_net [get_bd_intf_pins gt_ref_clk] [get_bd_intf_pins cmac_usplus/gt_ref_clk]
connect_bd_intf_net [get_bd_intf_pins tx_in] [get_bd_intf_pins axis_register_slice/S_AXIS]
connect_bd_net [get_bd_pins cmac_control/reset_rx_datapath] [get_bd_pins cmac_usplus/gtwiz_reset_rx_datapath]
connect_bd_net [get_bd_pins cmac_control/rx_resetn_out] [get_bd_pins rx_cdc/cmac_resetn] [get_bd_pins axis_register_slice/aresetn]
connect_bd_net [get_bd_pins cmac_control/sync_rx_aligned] [get_bd_pins rx_aligned]
connect_bd_net [get_bd_pins cmac_usplus/gt_txusrclk2] \
  [get_bd_pins rx_cdc/cmac_clk] [get_bd_pins cmac_usplus/rx_clk] [get_bd_pins cmac_control/rx_clk] [get_bd_pins cmac_clk] \
  [get_bd_pins axis_register_slice/aclk]
connect_bd_net [get_bd_pins sys_clk] \
  [get_bd_pins rx_cdc/sys_clk] [get_bd_pins cmac_usplus/gt_drpclk] [get_bd_pins cmac_usplus/init_clk] \
  [get_bd_pins cmac_usplus/drp_clk]
connect_bd_net [get_bd_pins sys_resetn_in] [get_bd_pins cmac_control/sys_resetn_in]

current_bd_instance /cmac/eth0/rx_cdc
connect_bd_intf_net [get_bd_intf_pins S_AXIS] [get_bd_intf_pins axis_register_slice/S_AXIS]
connect_bd_intf_net [get_bd_intf_pins M_AXIS] [get_bd_intf_pins cdc_fifo/M_AXIS]
connect_bd_intf_net [get_bd_intf_pins axis_register_slice/M_AXIS] [get_bd_intf_pins cdc_fifo/S_AXIS]
connect_bd_net -net cmac_control_rx_resetn_out [get_bd_pins cmac_resetn] \
  [get_bd_pins cdc_fifo/s_axis_aresetn] [get_bd_pins axis_register_slice/aresetn]
connect_bd_net -net cmac_usplus_gt_txusrclk2 [get_bd_pins cmac_clk] [get_bd_pins cdc_fifo/s_axis_aclk] [get_bd_pins axis_register_slice/aclk]
connect_bd_net [get_bd_pins sys_clk] [get_bd_pins cdc_fifo/m_axis_aclk]

current_bd_instance /cmac/eth_1
connect_bd_intf_net [get_bd_intf_pins rx_out] [get_bd_intf_pins rx_cdc/M_AXIS]
connect_bd_intf_net [get_bd_intf_pins axis_register_slice/M_AXIS] [get_bd_intf_pins cmac_usplus/axis_tx]
connect_bd_intf_net [get_bd_intf_pins cmac_control/ctl_rx] [get_bd_intf_pins cmac_usplus/ctl_rx]
connect_bd_intf_net [get_bd_intf_pins cmac_control/ctl_tx] [get_bd_intf_pins cmac_usplus/ctl_tx]
connect_bd_intf_net [get_bd_intf_pins cmac_control/gt_trans_debug] [get_bd_intf_pins cmac_usplus/gt_trans_debug]
connect_bd_intf_net [get_bd_intf_pins cmac_control/rs_fec] [get_bd_intf_pins cmac_usplus/rs_fec_in]
connect_bd_intf_net [get_bd_intf_pins cmac_usplus/axis_rx] [get_bd_intf_pins rx_cdc/S_AXIS]
connect_bd_intf_net [get_bd_intf_pins gt_serial_port] [get_bd_intf_pins cmac_usplus/gt_serial_port]
connect_bd_intf_net [get_bd_intf_pins cmac_control/stat_rx] [get_bd_intf_pins cmac_usplus/stat_rx]
connect_bd_intf_net [get_bd_intf_pins gt_ref_clk] [get_bd_intf_pins cmac_usplus/gt_ref_clk]
connect_bd_intf_net [get_bd_intf_pins tx_in] [get_bd_intf_pins axis_register_slice/S_AXIS]
connect_bd_net [get_bd_pins cmac_control/reset_rx_datapath] [get_bd_pins cmac_usplus/gtwiz_reset_rx_datapath]
connect_bd_net [get_bd_pins cmac_control/rx_resetn_out] [get_bd_pins rx_cdc/cmac_resetn] [get_bd_pins axis_register_slice/aresetn]
connect_bd_net [get_bd_pins cmac_control/sync_rx_aligned] [get_bd_pins rx_aligned]
connect_bd_net [get_bd_pins cmac_usplus/gt_txusrclk2] \
  [get_bd_pins cmac_usplus/rx_clk] [get_bd_pins cmac_control/rx_clk] [get_bd_pins cmac_clk] [get_bd_pins rx_cdc/cmac_clk] \
  [get_bd_pins axis_register_slice/aclk]
connect_bd_net [get_bd_pins sys_clk] \
  [get_bd_pins cmac_usplus/gt_drpclk] [get_bd_pins cmac_usplus/init_clk] [get_bd_pins cmac_usplus/drp_clk] \
  [get_bd_pins rx_cdc/sys_clk]
connect_bd_net [get_bd_pins sys_resetn_in] [get_bd_pins cmac_control/sys_resetn_in]

current_bd_instance /cmac/eth_1/rx_cdc
connect_bd_intf_net [get_bd_intf_pins S_AXIS] [get_bd_intf_pins axis_register_slice/S_AXIS]
connect_bd_intf_net [get_bd_intf_pins M_AXIS] [get_bd_intf_pins rx_cdc/M_AXIS]
connect_bd_intf_net [get_bd_intf_pins axis_register_slice/M_AXIS] [get_bd_intf_pins rx_cdc/S_AXIS]
connect_bd_net -net cmac_control_rx_resetn_out [get_bd_pins cmac_resetn] [get_bd_pins rx_cdc/s_axis_aresetn] [get_bd_pins axis_register_slice/aresetn]
connect_bd_net -net cmac_usplus_gt_txusrclk2 [get_bd_pins cmac_clk] [get_bd_pins rx_cdc/s_axis_aclk] [get_bd_pins axis_register_slice/aclk]
connect_bd_net [get_bd_pins sys_clk] [get_bd_pins rx_cdc/m_axis_aclk]

current_bd_instance /clk_192
connect_bd_intf_net [get_bd_intf_pins init_clk] [get_bd_intf_pins clock_gen_192/CLK_IN1_D]
connect_bd_net -net clk_wiz_clk192 [get_bd_pins clock_gen_192/clk192] [get_bd_pins clk192] [get_bd_pins xpm_cdc_gen_0/dest_clk]
connect_bd_net [get_bd_pins sys_resetn] [get_bd_pins xpm_cdc_gen_0/src_arst]
connect_bd_net [get_bd_pins xpm_cdc_gen_0/dest_arst] [get_bd_pins resetn_192]

current_bd_instance /misc
connect_bd_intf_net [get_bd_intf_pins S00_AXI] [get_bd_intf_pins smartconnect/S00_AXI]
connect_bd_intf_net [get_bd_intf_pins misc/S_AXI] [get_bd_intf_pins smartconnect/M04_AXI]
connect_bd_intf_net [get_bd_intf_pins TEC/S_AXI] [get_bd_intf_pins smartconnect/M06_AXI]
connect_bd_intf_net [get_bd_intf_pins uci_adc_bank/S_AXI_CTL] [get_bd_intf_pins smartconnect/M01_AXI]
connect_bd_intf_net [get_bd_intf_pins dig_adc_bank/S_AXI_CTL] [get_bd_intf_pins smartconnect/M03_AXI]
connect_bd_intf_net [get_bd_intf_pins aux_adc_bank/S_AXI_CTL] [get_bd_intf_pins smartconnect/M05_AXI]
connect_bd_intf_net [get_bd_intf_pins NCT72D_0] [get_bd_intf_pins TEC/NCT72D_0]
connect_bd_intf_net [get_bd_intf_pins NCT72D_1] [get_bd_intf_pins TEC/NCT72D_1]
connect_bd_intf_net [get_bd_intf_pins EEPROM] [get_bd_intf_pins eeprom/EEPROM]
connect_bd_intf_net [get_bd_intf_pins chip_power_ctl/S_AXI] [get_bd_intf_pins smartconnect/M00_AXI]
connect_bd_intf_net [get_bd_intf_pins eeprom/S_AXI] [get_bd_intf_pins smartconnect/M02_AXI]
connect_bd_net [get_bd_pins AUX_ADC_MISO] [get_bd_pins aux_adc_bank/ADC_MISO]
connect_bd_net [get_bd_pins CHIP_DETECT] [get_bd_pins chip_power_ctl/async_chip_detect]
connect_bd_net -net CLAMPN_1 [get_bd_pins CHIP_CLAMP] [get_bd_pins chip_power_ctl/async_clamp]
connect_bd_net [get_bd_pins DIG_ADC_MISO] [get_bd_pins dig_adc_bank/ADC_MISO]
connect_bd_net [get_bd_pins FPGA_FAN_TACH] [get_bd_pins misc/fpga_fan_tach]
connect_bd_net [get_bd_pins PCB_FAN_TACH] [get_bd_pins misc/pcb_fan_tach]
connect_bd_net [get_bd_pins UCI_ADC_MISO] [get_bd_pins uci_adc_bank/ADC_MISO]
connect_bd_net -net adc_bank1_DIG_ADC_CSN [get_bd_pins dig_adc_bank/ADC_CSN] [get_bd_pins DIG_ADC_CSN]
connect_bd_net -net adc_bank1_DIG_ADC_MOSI [get_bd_pins dig_adc_bank/ADC_MOSI] [get_bd_pins DIG_ADC_MOSI]
connect_bd_net -net adc_bank1_DIG_ADC_SCK [get_bd_pins dig_adc_bank/ADC_SCK] [get_bd_pins DIG_ADC_SCK]
connect_bd_net -net adc_bank_UCI_ADC_CSN [get_bd_pins uci_adc_bank/ADC_CSN] [get_bd_pins UCI_ADC_CSN]
connect_bd_net -net adc_bank_UCI_ADC_MOSI [get_bd_pins uci_adc_bank/ADC_MOSI] [get_bd_pins UCI_ADC_MOSI]
connect_bd_net -net adc_bank_UCI_ADC_SCK [get_bd_pins uci_adc_bank/ADC_SCK] [get_bd_pins UCI_ADC_SCK]
connect_bd_net [get_bd_pins aux_adc_bank/ADC_CSN] [get_bd_pins AUX_ADC_CSN]
connect_bd_net [get_bd_pins aux_adc_bank/ADC_MOSI] [get_bd_pins AUX_ADC_MOSI]
connect_bd_net [get_bd_pins aux_adc_bank/ADC_SCK] [get_bd_pins AUX_ADC_SCK]
connect_bd_net [get_bd_pins chip_power_ctl/chip_reset_n] [get_bd_pins CHIP_RESET_N]
connect_bd_net [get_bd_pins chip_power_ctl/chip_vdd] [get_bd_pins CHIP_VDD]
connect_bd_net [get_bd_pins chip_power_ctl/chip_vdda] [get_bd_pins CHIP_VDDA]
connect_bd_net [get_bd_pins chip_power_ctl/chip_vddio] [get_bd_pins CHIP_VDDIO]
connect_bd_net [get_bd_pins chip_power_ctl/chip_vddlvds] [get_bd_pins CHIP_VDDLVDS]
connect_bd_net [get_bd_pins chip_power_ctl/lvl_trsl_oe_n] [get_bd_pins LVL_TRSL_OE_N]
connect_bd_net [get_bd_pins clk] \
  [get_bd_pins uci_adc_bank/clk] [get_bd_pins smartconnect/aclk] [get_bd_pins dig_adc_bank/clk] [get_bd_pins misc/clk] \
  [get_bd_pins aux_adc_bank/clk] [get_bd_pins eeprom/clk] [get_bd_pins TEC/clk] [get_bd_pins chip_power_ctl/clk]
connect_bd_net [get_bd_pins ilconstant_0/dout] [get_bd_pins C1_0]
connect_bd_net [get_bd_pins ilconstant_1/dout] [get_bd_pins C1_1]
connect_bd_net [get_bd_pins misc/otp_enable] [get_bd_pins OTP_ENAB]
connect_bd_net [get_bd_pins qsfp_pins/qsfp_lp] [get_bd_pins qsfp_lp]
connect_bd_net [get_bd_pins qsfp_pins/qsfp_rst_l] [get_bd_pins qsfp_rst_l]
connect_bd_net [get_bd_pins resetn] \
  [get_bd_pins uci_adc_bank/resetn] [get_bd_pins smartconnect/aresetn] [get_bd_pins dig_adc_bank/resetn] \
  [get_bd_pins misc/resetn] [get_bd_pins aux_adc_bank/resetn] [get_bd_pins eeprom/resetn] [get_bd_pins TEC/resetn] \
  [get_bd_pins chip_power_ctl/resetn]

current_bd_instance /misc/uci_adc_bank
connect_bd_intf_net [get_bd_intf_pins S_AXI_CTL] [get_bd_intf_pins axi_adc_bank/S_AXI]
connect_bd_net -net UCI_ADC_MISO_1 [get_bd_pins ADC_MISO] [get_bd_pins ltc1867l/spi_miso]
connect_bd_net [get_bd_pins ltc1867l/adc_values] [get_bd_pins axi_adc_bank/adc]
connect_bd_net [get_bd_pins ltc1867l/slave_select] [get_bd_pins ADC_CSN]
connect_bd_net [get_bd_pins ltc1867l/spi_mosi] [get_bd_pins ADC_MOSI]
connect_bd_net [get_bd_pins ltc1867l/spi_sclk] [get_bd_pins ADC_SCK]
connect_bd_net -net pcie_bridge_0_axi_aclk [get_bd_pins clk] [get_bd_pins ltc1867l/clk] [get_bd_pins axi_adc_bank/clk]
connect_bd_net -net pcie_bridge_0_axi_aresetn [get_bd_pins resetn] [get_bd_pins ltc1867l/resetn] [get_bd_pins axi_adc_bank/resetn]

current_bd_instance /misc/dig_adc_bank
connect_bd_intf_net [get_bd_intf_pins S_AXI_CTL] [get_bd_intf_pins axi_adc_bank/S_AXI]
connect_bd_net -net UCI_ADC_MISO_1 [get_bd_pins ADC_MISO] [get_bd_pins ltc1867l/spi_miso]
connect_bd_net [get_bd_pins ltc1867l/adc_values] [get_bd_pins axi_adc_bank/adc]
connect_bd_net [get_bd_pins ltc1867l/slave_select] [get_bd_pins ADC_CSN]
connect_bd_net [get_bd_pins ltc1867l/spi_mosi] [get_bd_pins ADC_MOSI]
connect_bd_net [get_bd_pins ltc1867l/spi_sclk] [get_bd_pins ADC_SCK]
connect_bd_net -net pcie_bridge_0_axi_aclk [get_bd_pins clk] [get_bd_pins ltc1867l/clk] [get_bd_pins axi_adc_bank/clk]
connect_bd_net -net pcie_bridge_0_axi_aresetn [get_bd_pins resetn] [get_bd_pins ltc1867l/resetn] [get_bd_pins axi_adc_bank/resetn]

current_bd_instance /misc/misc
connect_bd_intf_net [get_bd_intf_pins S_AXI] [get_bd_intf_pins misc_ctl/S_AXI]
connect_bd_net -net async_tach_pin_1 [get_bd_pins fpga_fan_tach] [get_bd_pins fpga_fan_tach/async_tach_pin]
connect_bd_net [get_bd_pins clk] [get_bd_pins fpga_fan_tach/clk] [get_bd_pins pcb_fan_tach/clk] [get_bd_pins misc_ctl/clk]
connect_bd_net [get_bd_pins fpga_fan_tach/tach_count] [get_bd_pins misc_ctl/fpga_fan_tach]
connect_bd_net [get_bd_pins misc_ctl/otp_enable] [get_bd_pins otp_enable]
connect_bd_net [get_bd_pins pcb_fan_tach] [get_bd_pins pcb_fan_tach/async_tach_pin]
connect_bd_net [get_bd_pins pcb_fan_tach/tach_count] [get_bd_pins misc_ctl/pcb_fan_tach]
connect_bd_net [get_bd_pins resetn] [get_bd_pins misc_ctl/resetn]

current_bd_instance /misc/aux_adc_bank
connect_bd_intf_net [get_bd_intf_pins S_AXI_CTL] [get_bd_intf_pins axi_adc_bank/S_AXI]
connect_bd_net -net UCI_ADC_MISO_1 [get_bd_pins ADC_MISO] [get_bd_pins ltc1867l/spi_miso]
connect_bd_net [get_bd_pins ltc1867l/adc_values] [get_bd_pins axi_adc_bank/adc]
connect_bd_net [get_bd_pins ltc1867l/slave_select] [get_bd_pins ADC_CSN]
connect_bd_net [get_bd_pins ltc1867l/spi_mosi] [get_bd_pins ADC_MOSI]
connect_bd_net [get_bd_pins ltc1867l/spi_sclk] [get_bd_pins ADC_SCK]
connect_bd_net -net pcie_bridge_0_axi_aclk [get_bd_pins clk] [get_bd_pins ltc1867l/clk] [get_bd_pins axi_adc_bank/clk]
connect_bd_net -net pcie_bridge_0_axi_aresetn [get_bd_pins resetn] [get_bd_pins ltc1867l/resetn] [get_bd_pins axi_adc_bank/resetn]

current_bd_instance /misc/eeprom
connect_bd_intf_net [get_bd_intf_pins S_AXI] [get_bd_intf_pins eeprom_ctl/S_AXI]
connect_bd_intf_net [get_bd_intf_pins EEPROM] [get_bd_intf_pins eeprom_iic/IIC]
connect_bd_intf_net [get_bd_intf_pins i2c_master/M_AXI] [get_bd_intf_pins eeprom_iic/S_AXI]
connect_bd_net [get_bd_pins clk] [get_bd_pins i2c_master/clk] [get_bd_pins eeprom_iic/s_axi_aclk] [get_bd_pins eeprom_ctl/clk]
connect_bd_net [get_bd_pins eeprom_ctl/big_endian] [get_bd_pins i2c_master/big_endian]
connect_bd_net [get_bd_pins eeprom_ctl/cmd] [get_bd_pins i2c_master/cmd]
connect_bd_net [get_bd_pins eeprom_ctl/cmd_start_stb] [get_bd_pins i2c_master/cmd_start_stb]
connect_bd_net [get_bd_pins eeprom_ctl/extra_bytes] [get_bd_pins i2c_master/extra_bytes]
connect_bd_net [get_bd_pins eeprom_ctl/i2c_addr] [get_bd_pins i2c_master/i2c_addr]
connect_bd_net [get_bd_pins eeprom_ctl/reg_addr] [get_bd_pins i2c_master/reg_addr]
connect_bd_net [get_bd_pins eeprom_ctl/wdata] [get_bd_pins i2c_master/wdata]
connect_bd_net [get_bd_pins i2c_master/i2c_error] [get_bd_pins eeprom_ctl/i2c_error]
connect_bd_net [get_bd_pins i2c_master/idle] [get_bd_pins eeprom_ctl/idle]
connect_bd_net [get_bd_pins i2c_master/rdata] [get_bd_pins eeprom_ctl/rdata]
connect_bd_net [get_bd_pins resetn] [get_bd_pins i2c_master/resetn] [get_bd_pins eeprom_iic/s_axi_aresetn] [get_bd_pins eeprom_ctl/resetn]

current_bd_instance /misc/TEC
connect_bd_intf_net [get_bd_intf_pins S_AXI] [get_bd_intf_pins tec_ctl/S_AXI]
connect_bd_intf_net [get_bd_intf_pins NCT72D_0] [get_bd_intf_pins nct72d_0/IIC]
connect_bd_intf_net [get_bd_intf_pins NCT72D_1] [get_bd_intf_pins nct72d_1/IIC]
connect_bd_net [get_bd_pins clk] [get_bd_pins nct72d_0/clk] [get_bd_pins nct72d_1/clk] [get_bd_pins tec_ctl/clk]
connect_bd_net [get_bd_pins nct72d_0/error] [get_bd_pins tec_ctl/sensor_err_0]
connect_bd_net [get_bd_pins nct72d_0/external_temp] [get_bd_pins tec_ctl/external_temp_0]
connect_bd_net [get_bd_pins nct72d_0/internal_temp] [get_bd_pins tec_ctl/internal_temp_0]
connect_bd_net [get_bd_pins nct72d_1/error] [get_bd_pins tec_ctl/sensor_err_1]
connect_bd_net [get_bd_pins nct72d_1/external_temp] [get_bd_pins tec_ctl/external_temp_1]
connect_bd_net [get_bd_pins nct72d_1/internal_temp] [get_bd_pins tec_ctl/internal_temp_1]
connect_bd_net [get_bd_pins resetn] [get_bd_pins nct72d_0/resetn] [get_bd_pins nct72d_1/resetn] [get_bd_pins tec_ctl/resetn]
connect_bd_net [get_bd_pins tec_ctl/clear_sensor_err_stb_0] [get_bd_pins nct72d_0/clear_error_stb]
connect_bd_net [get_bd_pins tec_ctl/clear_sensor_err_stb_1] [get_bd_pins nct72d_1/clear_error_stb]

current_bd_instance /misc/TEC/nct72d_0
connect_bd_intf_net [get_bd_intf_pins IIC] [get_bd_intf_pins axi_iic/IIC]
connect_bd_intf_net [get_bd_intf_pins i2c_master/M_AXI] [get_bd_intf_pins axi_iic/S_AXI]
connect_bd_net [get_bd_pins clear_error_stb] [get_bd_pins nct72_mgr/clear_error_stb]
connect_bd_net [get_bd_pins clk] [get_bd_pins axi_iic/s_axi_aclk] [get_bd_pins i2c_master/clk] [get_bd_pins nct72_mgr/clk]
connect_bd_net [get_bd_pins i2c_master/i2c_error] [get_bd_pins nct72_mgr/i2c_error]
connect_bd_net [get_bd_pins i2c_master/idle] [get_bd_pins nct72_mgr/i2c_idle]
connect_bd_net [get_bd_pins i2c_master/rdata] [get_bd_pins nct72_mgr/i2c_rdata]
connect_bd_net [get_bd_pins nct72_mgr/error] [get_bd_pins error]
connect_bd_net [get_bd_pins nct72_mgr/external_temp] [get_bd_pins external_temp]
connect_bd_net [get_bd_pins nct72_mgr/i2c_addr] [get_bd_pins i2c_master/i2c_addr]
connect_bd_net [get_bd_pins nct72_mgr/i2c_big_endian] [get_bd_pins i2c_master/big_endian]
connect_bd_net [get_bd_pins nct72_mgr/i2c_cmd] [get_bd_pins i2c_master/cmd]
connect_bd_net [get_bd_pins nct72_mgr/i2c_extra_bytes] [get_bd_pins i2c_master/extra_bytes]
connect_bd_net [get_bd_pins nct72_mgr/i2c_reg_addr] [get_bd_pins i2c_master/reg_addr]
connect_bd_net [get_bd_pins nct72_mgr/i2c_start_stb] [get_bd_pins i2c_master/cmd_start_stb]
connect_bd_net [get_bd_pins nct72_mgr/i2c_wdata] [get_bd_pins i2c_master/wdata]
connect_bd_net [get_bd_pins nct72_mgr/internal_temp] [get_bd_pins internal_temp]
connect_bd_net [get_bd_pins resetn] [get_bd_pins axi_iic/s_axi_aresetn] [get_bd_pins i2c_master/resetn] [get_bd_pins nct72_mgr/resetn]

current_bd_instance /misc/TEC/nct72d_1
connect_bd_intf_net [get_bd_intf_pins IIC] [get_bd_intf_pins axi_iic/IIC]
connect_bd_intf_net [get_bd_intf_pins i2c_master/M_AXI] [get_bd_intf_pins axi_iic/S_AXI]
connect_bd_net [get_bd_pins clear_error_stb] [get_bd_pins nct72_mgr/clear_error_stb]
connect_bd_net [get_bd_pins clk] [get_bd_pins axi_iic/s_axi_aclk] [get_bd_pins i2c_master/clk] [get_bd_pins nct72_mgr/clk]
connect_bd_net [get_bd_pins i2c_master/i2c_error] [get_bd_pins nct72_mgr/i2c_error]
connect_bd_net [get_bd_pins i2c_master/idle] [get_bd_pins nct72_mgr/i2c_idle]
connect_bd_net [get_bd_pins i2c_master/rdata] [get_bd_pins nct72_mgr/i2c_rdata]
connect_bd_net [get_bd_pins nct72_mgr/error] [get_bd_pins error]
connect_bd_net [get_bd_pins nct72_mgr/external_temp] [get_bd_pins external_temp]
connect_bd_net [get_bd_pins nct72_mgr/i2c_addr] [get_bd_pins i2c_master/i2c_addr]
connect_bd_net [get_bd_pins nct72_mgr/i2c_big_endian] [get_bd_pins i2c_master/big_endian]
connect_bd_net [get_bd_pins nct72_mgr/i2c_cmd] [get_bd_pins i2c_master/cmd]
connect_bd_net [get_bd_pins nct72_mgr/i2c_extra_bytes] [get_bd_pins i2c_master/extra_bytes]
connect_bd_net [get_bd_pins nct72_mgr/i2c_reg_addr] [get_bd_pins i2c_master/reg_addr]
connect_bd_net [get_bd_pins nct72_mgr/i2c_start_stb] [get_bd_pins i2c_master/cmd_start_stb]
connect_bd_net [get_bd_pins nct72_mgr/i2c_wdata] [get_bd_pins i2c_master/wdata]
connect_bd_net [get_bd_pins nct72_mgr/internal_temp] [get_bd_pins internal_temp]
connect_bd_net [get_bd_pins resetn] [get_bd_pins axi_iic/s_axi_aresetn] [get_bd_pins i2c_master/resetn] [get_bd_pins nct72_mgr/resetn]
